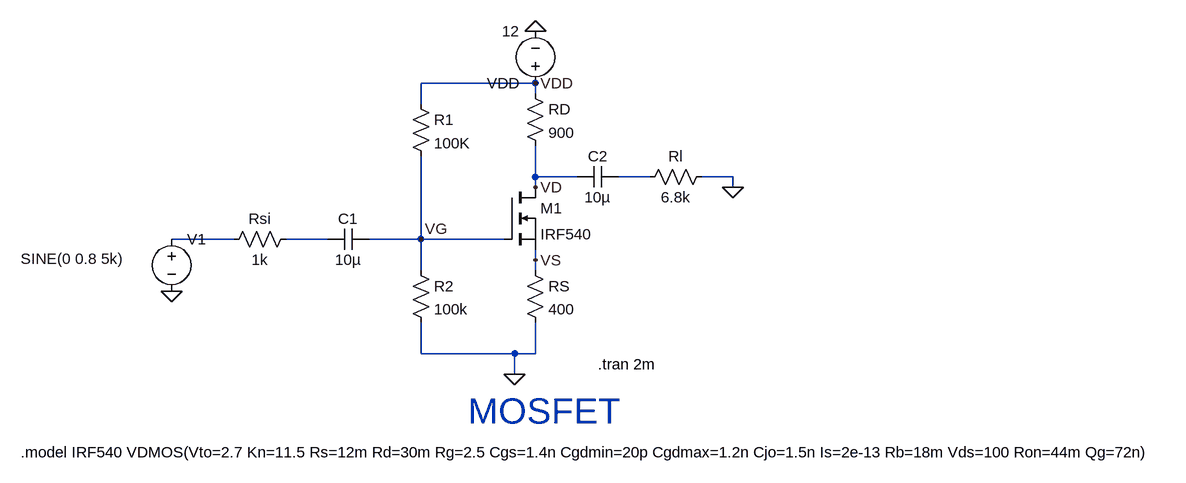
[diagram p0: schematic mosfet amp.asc]
mosfet amp.asc, the LTspice schematic file:
Version 4.1
SHEET 1 2044 680
WIRE 896 -128 720 -128
WIRE 896 -112 896 -128
WIRE 720 -96 720 -128
WIRE 896 16 896 -32
WIRE 960 16 896 16
WIRE 1072 16 1024 16
WIRE 1200 16 1152 16
WIRE 896 32 896 16
WIRE 1200 32 1200 16
WIRE 432 112 336 112
WIRE 576 112 512 112
WIRE 720 112 720 -16
WIRE 720 112 640 112
WIRE 848 112 720 112
WIRE 896 144 896 128
WIRE 720 160 720 112
WIRE 896 160 896 144
WIRE 720 288 720 240
WIRE 864 288 720 288
WIRE 896 288 896 240
WIRE 896 288 864 288
WIRE 864 320 864 288
FLAG 864 320 0
FLAG 896 -128 VDD
FLAG 720 112 VG
FLAG 896 144 VS
FLAG 896 32 VD
FLAG 896 -208 0
FLAG 336 192 0
FLAG 1200 32 0
SYMBOL nmos 848 32 R0
SYMATTR InstName M1
SYMATTR Value IRF540
SYMBOL res 880 -128 R0
SYMATTR InstName RD
SYMATTR Value 900
SYMBOL voltage 896 -112 R180
WINDOW 123 0 0 Left 0
WINDOW 39 0 0 Left 0
SYMATTR InstName VDD
SYMATTR Value 12
SYMBOL res 880 144 R0
SYMATTR InstName RS
SYMATTR Value 400
SYMBOL res 704 144 R0
SYMATTR InstName R2
SYMATTR Value 100k
SYMBOL res 704 -112 R0
SYMATTR InstName R1
SYMATTR Value 100K
SYMBOL cap 640 96 R90
WINDOW 0 0 32 VBottom 2
WINDOW 3 32 32 VTop 2
SYMATTR InstName C1
SYMATTR Value 10µ
SYMBOL voltage 336 96 R0
WINDOW 3 -232 46 Left 2
WINDOW 123 0 0 Left 0
WINDOW 39 0 0 Left 0
SYMATTR Value SINE(0 0.8 5k)
SYMATTR InstName V1
SYMBOL cap 1024 0 R90
WINDOW 0 0 32 VBottom 2
WINDOW 3 32 32 VTop 2
SYMATTR InstName C2
SYMATTR Value 10µ
SYMBOL res 1168 0 R90
WINDOW 0 0 56 VBottom 2
WINDOW 3 32 56 VTop 2
SYMATTR InstName Rl
SYMATTR Value 6.8k
SYMBOL res 528 96 R90
WINDOW 0 0 56 VBottom 2
WINDOW 3 32 56 VTop 2
SYMATTR InstName Rsi
SYMATTR Value 1k
TEXT 792 376 Left 5 ;MOSFET
TEXT 104 440 Left 2 !.model IRF540 VDMOS(Vto=2.7 Kn=11.5 Rs=12m Rd=30m Rg=2.5 Cgs=1.4n Cgdmin=20p Cgdmax=1.2n Cjo=1.5n Is=2e-13 Rb=18m Vds=100 Ron=44m Qg=72n)
TEXT 992 304 Left 2 !.tran 2m

The netlist it stands for:
* mosfet amp.asc
M1 VD VG VS VS IRF540
RD VDD VD 900
VDD VDD 0 12
RS VS 0 400
R2 VG 0 100k
R1 VDD VG 100K
C1 VG N003 10µ
V1 N002 0 SINE(0 0.8 5k)
C2 N001 VD 10µ
Rl 0 N001 6.8k
Rsi N003 N002 1k
.model NMOS NMOS
.model PMOS PMOS
.lib standard.mos
* MOSFET
.model IRF540 VDMOS(Vto=2.7 Kn=11.5 Rs=12m Rd=30m Rg=2.5 Cgs=1.4n Cgdmin=20p Cgdmax=1.2n Cjo=1.5n Is=2e-13 Rb=18m Vds=100 Ron=44m Qg=72n)
.tran 2m
.backanno
.end